# Altium schematic sheet Karta_ILS_TETRA.SchDoc: Kart ILS
size A3; SheetNumber: 2; SheetTotal: 17
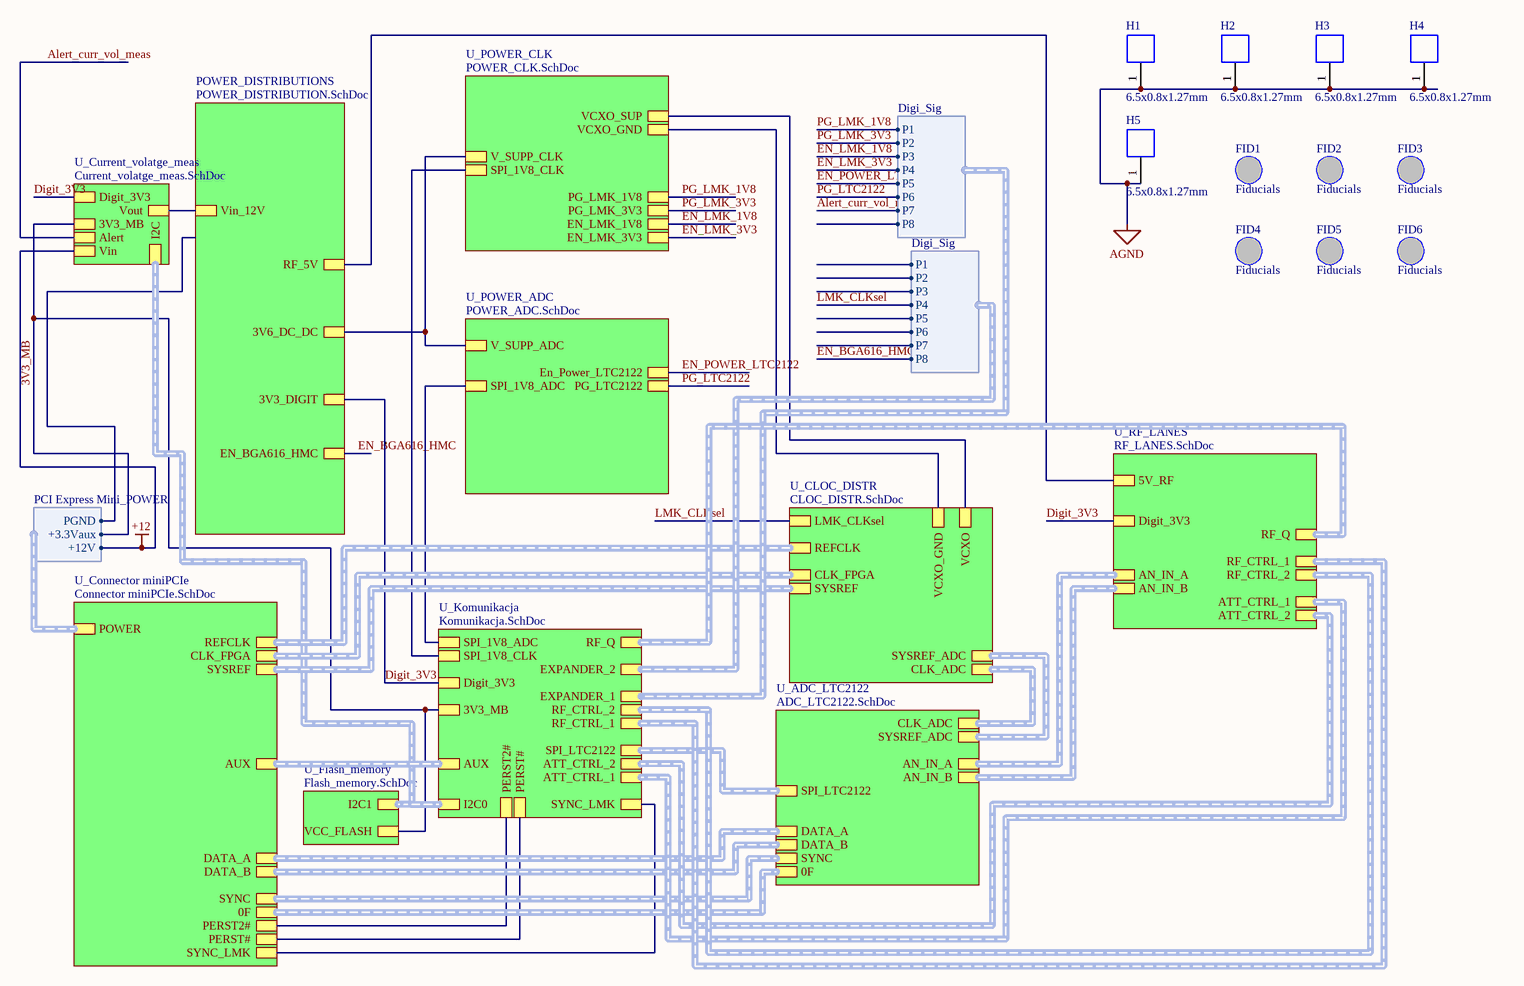
[diagram p0: Karta_ILS_TETRA.SchDoc]

## Parts
FID1  Fiducials  [Fiducials]
FID2  Fiducials  [Fiducials]
FID3  Fiducials  [Fiducials]
FID4  Fiducials  [Fiducials]
FID5  Fiducials  [Fiducials]
FID6  Fiducials  [Fiducials]
H1  6.5x0.8x1.27mm  [36900000]
H2  6.5x0.8x1.27mm  [36900000]
H3  6.5x0.8x1.27mm  [36900000]
H4  6.5x0.8x1.27mm  [36900000]
H5  6.5x0.8x1.27mm  [36900000]

## Sub-sheets
POWER_DISTRIBUTIONS = POWER_DISTRIBUTION.SchDoc: Vin_12V, 3V3_DIGIT, 3V6_DC_DC, RF_5V, EN_BGA616_HMC
U_ADC_LTC2122 = ADC_LTC2122.SchDoc: DATA_A (harness DATA_OUT), DATA_B (harness DATA_OUT), SYNC (harness CLK_DIFF), 0F (harness CLK_DIFF), CLK_ADC (harness CLK_DIFF), SYSREF_ADC (harness CLK_DIFF), AN_IN_A (harness DIFF_ANAL), SPI_LTC2122 (harness SPI), AN_IN_B (harness DIFF_ANAL)
U_CLOC_DISTR = CLOC_DISTR.SchDoc: REFCLK (harness CLK_DIFF), SYSREF (harness CLK_DIFF), SYSREF_ADC (harness CLK_DIFF), CLK_ADC (harness CLK_DIFF), LMK_CLKsel, VCXO_GND, VCXO, CLK_FPGA
U_Connector miniPCIe = Connector miniPCIe.SchDoc: DATA_B (harness DATA_OUT), POWER (harness PCI Express Mini_POWER), SYNC (harness CLK_DIFF), REFCLK (harness PCI Express Mini_REFCLK), 0F (harness CLK_DIFF), SYSREF (harness SYSREF), AUX (harness PCI Express Mini_AUXILIARY), DATA_A (harness DATA_OUT), PERST#, PERST2#, SYNC_LMK, CLK_FPGA (harness CLK_DIFF)
U_Current_volatge_meas = Current_volatge_meas.SchDoc: I2C (harness I2C), Alert, 3V3_MB, Vin, Vout, Digit_3V3
U_Flash_memory = Flash_memory.SchDoc: VCC_FLASH, I2C1
U_Komunikacja = Komunikacja.SchDoc: Digit_3V3, AUX (harness PCI Express Mini_AUXILIARY), SPI_1V8_ADC, 3V3_MB, EXPANDER_1 (harness Digi_Sig), SPI_LTC2122 (harness SPI), PERST#, EXPANDER_2 (harness Digi_Sig), ATT_CTRL_2, ATT_CTRL_1 (harness ATT_Controle), I2C0 (harness I2C), PERST2#, SYNC_LMK, SPI_1V8_CLK, RF_CTRL_2, RF_CTRL_1, RF_Q
U_POWER_ADC = POWER_ADC.SchDoc: V_SUPP_ADC, En_Power_LTC2122, PG_LTC2122, SPI_1V8_ADC
U_POWER_CLK = POWER_CLK.SchDoc: V_SUPP_CLK, EN_LMK_1V8, VCXO_GND, EN_LMK_3V3, VCXO_SUP, PG_LMK_1V8, PG_LMK_3V3, SPI_1V8_CLK
U_RF_LANES = RF_LANES.SchDoc: 5V_RF, AN_IN_A (harness Diff_Anal), AN_IN_B (harness Diff_Anal), ATT_CTRL_1 (harness ATT_CTRL), ATT_CTRL_2 (harness ATT_CTRL), Digit_3V3, RF_CTRL_1, RF_CTRL_2, RF_Q (harness RF_CTRL)

## Harnesses
Digi_Sig: P1, P2, P3, P4, P5, P6, P7, P8
PCI Express Mini_POWER: +3.3Vaux, PGND, +12V

## Nets
+12: sheet U_Current_volatge_meas/Vin, sheet U_Connector miniPCIe/POWER.+12V
AGND: H1.1 H2.1 H3.1 H4.1 H5.1
3V3_MB: sheet U_Komunikacja/3V3_MB, sheet U_Current_volatge_meas/3V3_MB, sheet U_Flash_memory/VCC_FLASH, sheet U_Connector miniPCIe/POWER.+3.3Vaux
Alert_curr_vol_meas: sheet U_Current_volatge_meas/Alert, sheet U_Komunikacja/EXPANDER_1.P7
Digit_3V3: sheet POWER_DISTRIBUTIONS/3V3_DIGIT, sheet U_Komunikacja/Digit_3V3, sheet U_RF_LANES/Digit_3V3, sheet U_Current_volatge_meas/Digit_3V3
EN_BGA616_HMC: sheet POWER_DISTRIBUTIONS/EN_BGA616_HMC, sheet U_Komunikacja/EXPANDER_2.P8
EN_LMK_1V8: sheet U_POWER_CLK/EN_LMK_1V8, sheet U_Komunikacja/EXPANDER_1.P3
EN_LMK_3V3: sheet U_POWER_CLK/EN_LMK_3V3, sheet U_Komunikacja/EXPANDER_1.P4
EN_POWER_LTC2122: sheet U_POWER_ADC/En_Power_LTC2122, sheet U_Komunikacja/EXPANDER_1.P5
LMK_CLKsel: sheet U_CLOC_DISTR/LMK_CLKsel, sheet U_Komunikacja/EXPANDER_2.P4
PG_LMK_1V8: sheet U_POWER_CLK/PG_LMK_1V8, sheet U_Komunikacja/EXPANDER_1.P1
PG_LMK_3V3: sheet U_POWER_CLK/PG_LMK_3V3, sheet U_Komunikacja/EXPANDER_1.P2
PG_LTC2122: sheet U_POWER_ADC/PG_LTC2122, sheet U_Komunikacja/EXPANDER_1.P6
(unnamed): sheet POWER_DISTRIBUTIONS/Vin_12V, sheet U_Current_volatge_meas/Vout
(unnamed): sheet POWER_DISTRIBUTIONS/3V6_DC_DC, sheet U_POWER_ADC/V_SUPP_ADC, sheet U_POWER_CLK/V_SUPP_CLK
(unnamed): sheet POWER_DISTRIBUTIONS/RF_5V, sheet U_RF_LANES/5V_RF
(unnamed): sheet U_Komunikacja/SPI_1V8_ADC, sheet U_POWER_ADC/SPI_1V8_ADC
(unnamed): sheet U_Komunikacja/PERST#, sheet U_Connector miniPCIe/PERST#
(unnamed): sheet U_Komunikacja/PERST2#, sheet U_Connector miniPCIe/PERST2#
(unnamed): sheet U_Komunikacja/SYNC_LMK, sheet U_Connector miniPCIe/SYNC_LMK
(unnamed): sheet U_Komunikacja/SPI_1V8_CLK, sheet U_POWER_CLK/SPI_1V8_CLK
(unnamed): sheet U_CLOC_DISTR/VCXO_GND, sheet U_POWER_CLK/VCXO_GND
(unnamed): sheet U_CLOC_DISTR/VCXO, sheet U_POWER_CLK/VCXO_SUP

## Buses and harness runs
harness sheet U_ADC_LTC2122/0F = sheet U_Connector miniPCIe/0F
harness sheet U_ADC_LTC2122/AN_IN_A = sheet U_RF_LANES/AN_IN_A
harness sheet U_ADC_LTC2122/AN_IN_B = sheet U_RF_LANES/AN_IN_B
harness sheet U_ADC_LTC2122/CLK_ADC = sheet U_CLOC_DISTR/CLK_ADC
harness sheet U_ADC_LTC2122/DATA_A = sheet U_Connector miniPCIe/DATA_A
harness sheet U_ADC_LTC2122/DATA_B = sheet U_Connector miniPCIe/DATA_B
harness sheet U_ADC_LTC2122/SPI_LTC2122 = sheet U_Komunikacja/SPI_LTC2122
harness sheet U_ADC_LTC2122/SYNC = sheet U_Connector miniPCIe/SYNC
harness sheet U_ADC_LTC2122/SYSREF_ADC = sheet U_CLOC_DISTR/SYSREF_ADC
harness sheet U_CLOC_DISTR/CLK_FPGA = sheet U_Connector miniPCIe/CLK_FPGA
harness sheet U_CLOC_DISTR/REFCLK = sheet U_Connector miniPCIe/REFCLK
harness sheet U_CLOC_DISTR/SYSREF = sheet U_Connector miniPCIe/SYSREF
harness sheet U_Connector miniPCIe/AUX = sheet U_Komunikacja/AUX
harness sheet U_Current_volatge_meas/I2C = sheet U_Flash_memory/I2C1 = sheet U_Komunikacja/I2C0
harness sheet U_Komunikacja/ATT_CTRL_1 = sheet U_RF_LANES/ATT_CTRL_1
harness sheet U_Komunikacja/ATT_CTRL_2 = sheet U_RF_LANES/ATT_CTRL_2
harness sheet U_Komunikacja/RF_CTRL_1 = sheet U_RF_LANES/RF_CTRL_1
harness sheet U_Komunikacja/RF_CTRL_2 = sheet U_RF_LANES/RF_CTRL_2
harness sheet U_Komunikacja/RF_Q = sheet U_RF_LANES/RF_Q

## Notes on the sheet
- Title
- Size:
- Date:
- A3
- Number:
- Time:
- Revision:
- Sheet
- of
- File:

## Library data of the parts
FID1-FID6 = Fid
H1-H5 = 36900000: WE-SHC Shielding Cabinet, Clip, 6.5x0.8x1.27mm; Manufacturer: Wurth Elektronik; Plating: Tin; Base Material: Steel; ComponentLink1Description: Manufacturer; ComponentLink1URL: http://www.we-online.de; ComponentLink2Description: Datasheet; ComponentLink2URL: https://www.we-online.com/catalog/datasheet/36900000.pdf; Operating Temperature: -40 to +125degC; Packaging: Tape and Reel; Length: 6.5mm; Type: Clip; Height: 1.27mm; Manufacturer Part Number: 36900000; Mounting Technology: SMT; Published Date: April 2020; Width: 0.8mm